# Altium project TC264.PrjPcb
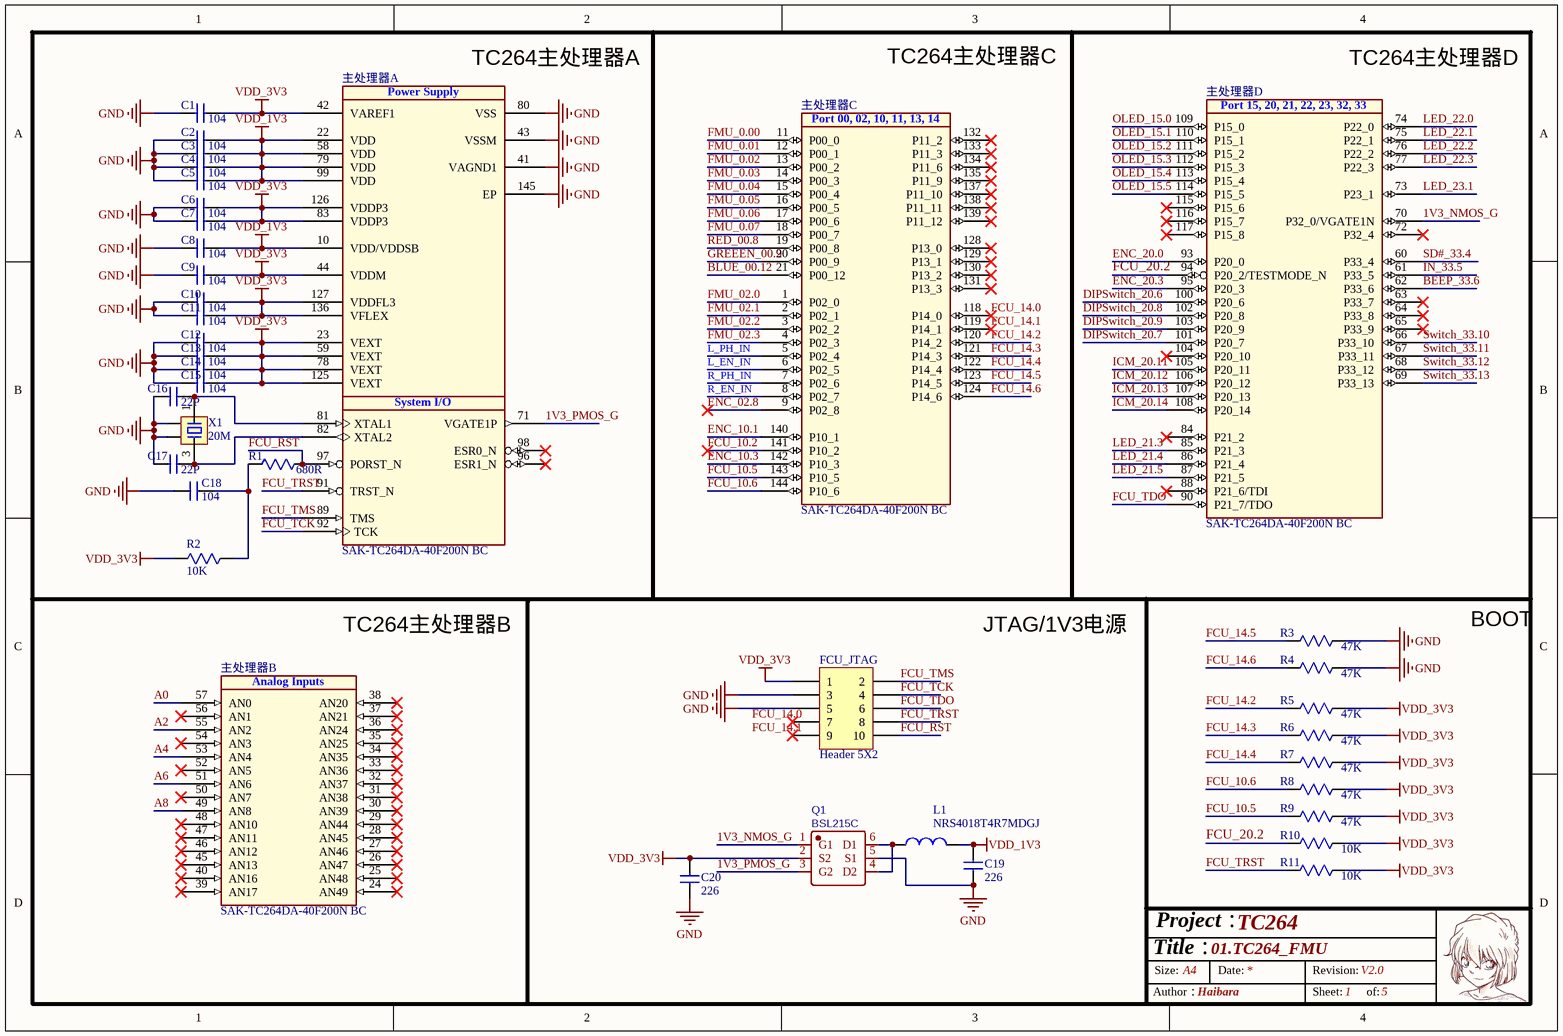
[diagram p0: 01.TC264_FMU.SchDoc]
4 sheets, 149 parts. Net scope: global (net labels, ports and power ports of the same name join across sheets).
Board file: TC264.PcbDoc
Sheets:
  01.TC264_FMU.SchDoc
  02.Power_Uint.SchDoc
  03.Communicate.SchDoc
  05.Motor_Drive.schdoc

## Sheet 01.TC264_FMU.SchDoc: 01.TC264_FMU
size A4; Revision: V2.0; SheetNumber: 1; SheetTotal: 5; Project: TC264

### Parts
C1  104  [C0402]
C2  104  [C0402]
C3  104  [C0402]
C4  104  [C0402]
C5  104  [C0402]
C6  104  [C0402]
C7  104  [C0402]
C8  104  [C0402]
C9  104  [C0402]
C10  104  [C0402]
C11  104  [C0402]
C12  104  [C0402]
C13  104  [C0402]
C14  104  [C0402]
C15  104  [C0402]
C16  22P  [C0603]
C17  22P  [C0603]
C18  104  [C0402]
C19  226  [C0805]
C20  226  [C0805]
FCU_JTAG  Header 5X2  [DC-2.54-L-Z-10P]
L1  NRS4018T4R7MDGJ  [SWPA4030S]
Q1  BSL215C  [SOT23-6]
R1  680R  [R0402]
R2  10K  [R0402]
R3  47K  [R0402]
R4  47K  [R0402]
R5  47K  [R0402]
R6  47K  [R0402]
R7  47K  [R0402]
R8  47K  [R0402]
R9  47K  [R0402]
R10  10K  [R0402]
R11  10K  [R0402]
X1  20M  [OSC 3225-4P]
主处理器  SAK-TC264DA-40F200N BC  [QFP144_EP]  (parts A,B,C,D of 4)

### Nets
GND: C1.1 C2.1 C3.1 C4.1 C5.1 C6.1 C7.1 C8.1 C9.1 C10.1 C11.1 C12.1 C13.1 C14.1 C15.1 C16.1 C17.1 C18.1 C19.1 C20.1 FCU_JTAG.3 FCU_JTAG.5 Q1.5(S1) R3.2 R4.2 X1.2 X1.4 主处理器.41(VAGND1) 主处理器.43(VSSM) 主处理器.80(VSS) 主处理器.145(EP)
VDD_1V3: C2.2 C3.2 C4.2 C5.2 C8.2 C19.2 L1.2 主处理器.10(VDD/VDDSB) 主处理器.22(VDD) 主处理器.58(VDD) 主处理器.79(VDD) 主处理器.99(VDD)
VDD_3V3: C1.2 C6.2 C7.2 C9.2 C10.2 C11.2 C12.2 C13.2 C14.2 C15.2 C20.2 FCU_JTAG.1 Q1.2(S2) R2.1 R5.2 R6.2 R7.2 R8.2 R9.2 R10.2 R11.2 主处理器.23(VEXT) 主处理器.42(VAREF1) 主处理器.44(VDDM) 主处理器.59(VEXT) 主处理器.78(VEXT) 主处理器.83(VDDP3) 主处理器.125(VEXT) 主处理器.126(VDDP3) 主处理器.127(VDDFL3) 主处理器.136(VFLEX)
1V3_NMOS_G: Q1.1(G1) 主处理器.70(P32_0/VGATE1N)
1V3_PMOS_G: Q1.3(G2) 主处理器.71(VGATE1P)
A0: 主处理器.57(AN0)
A2: 主处理器.55(AN2)
A4: 主处理器.53(AN4)
A6: 主处理器.51(AN6)
A8: 主处理器.49(AN8)
BEEP_33.6: 主处理器.62(P33_6)
BLUE_00.12: 主处理器.21(P00_12)
DIPSwitch_20.6: 主处理器.100(P20_6)
DIPSwitch_20.7: 主处理器.101(P20_7)
DIPSwitch_20.8: 主处理器.102(P20_8)
DIPSwitch_20.9: 主处理器.103(P20_9)
ENC_02.8: 主处理器.9(P02_8)
ENC_10.1: 主处理器.140(P10_1)
ENC_10.3: 主处理器.142(P10_3)
ENC_20.0: 主处理器.93(P20_0)
ENC_20.3: 主处理器.95(P20_3)
FCU_10.2: 主处理器.141(P10_2)
FCU_10.5: R9.1 主处理器.143(P10_5)
FCU_10.6: R8.1 主处理器.144(P10_6)
FCU_14.0: 主处理器.118(P14_0)
FCU_14.1: 主处理器.119(P14_1)
FCU_14.2: R5.1 主处理器.120(P14_2)
FCU_14.3: R6.1 主处理器.121(P14_3)
FCU_14.4: R7.1 主处理器.122(P14_4)
FCU_14.5: R3.1 主处理器.123(P14_5)
FCU_14.6: R4.1 主处理器.124(P14_6)
FCU_20.2: R10.1 主处理器.94(P20_2/TESTMODE_N)
FCU_RST: FCU_JTAG.10 R1.2 主处理器.97(PORST_N)
FCU_TCK: FCU_JTAG.4 主处理器.92(TCK)
FCU_TDO: FCU_JTAG.6 主处理器.90(P21_7/TDO)
FCU_TMS: FCU_JTAG.2 主处理器.89(TMS)
FCU_TRST: FCU_JTAG.8 R11.1 主处理器.91(TRST_N)
FMU_0.00: 主处理器.11(P00_0)
FMU_0.01: 主处理器.12(P00_1)
FMU_0.02: 主处理器.13(P00_2)
FMU_0.03: 主处理器.14(P00_3)
FMU_0.04: 主处理器.15(P00_4)
FMU_0.05: 主处理器.16(P00_5)
FMU_0.06: 主处理器.17(P00_6)
FMU_0.07: 主处理器.18(P00_7)
FMU_02.0: 主处理器.1(P02_0)
FMU_02.1: 主处理器.2(P02_1)
FMU_02.2: 主处理器.3(P02_2)
FMU_02.3: 主处理器.4(P02_3)
GREEEN_00.9: 主处理器.20(P00_9)
ICM_20.11: 主处理器.105(P20_11)
ICM_20.12: 主处理器.106(P20_12)
ICM_20.13: 主处理器.107(P20_13)
ICM_20.14: 主处理器.108(P20_14)
IN_33.5: 主处理器.61(P33_5)
L_EN_IN: 主处理器.6(P02_5)
L_PH_IN: 主处理器.5(P02_4)
LED_21.3: 主处理器.85(P21_3)
LED_21.4: 主处理器.86(P21_4)
LED_21.5: 主处理器.87(P21_5)
LED_22.0: 主处理器.74(P22_0)
LED_22.1: 主处理器.75(P22_1)
LED_22.2: 主处理器.76(P22_2)
LED_22.3: 主处理器.77(P22_3)
LED_23.1: 主处理器.73(P23_1)
OLED_15.0: 主处理器.109(P15_0)
OLED_15.1: 主处理器.110(P15_1)
OLED_15.2: 主处理器.111(P15_2)
OLED_15.3: 主处理器.112(P15_3)
OLED_15.4: 主处理器.113(P15_4)
OLED_15.5: 主处理器.114(P15_5)
R_EN_IN: 主处理器.8(P02_7)
R_PH_IN: 主处理器.7(P02_6)
RED_00.8: 主处理器.19(P00_8)
SD#_33.4: 主处理器.60(P33_4)
Switch_33.10: 主处理器.66(P33_10)
Switch_33.11: 主处理器.67(P33_11)
Switch_33.12: 主处理器.68(P33_12)
Switch_33.13: 主处理器.69(P33_13)
NetC16_2: C16.2 X1.1 主处理器.81(XTAL1)
NetC17_2: C17.2 X1.3 主处理器.82(XTAL2)
NetC18_2: C18.2 R1.1 R2.2
NetL1_1: L1.1 Q1.4(D2) Q1.6(D1)

Not connected (* = marked no-connect by the designer): FCU_JTAG 7* 9*; 主处理器 24(AN49)* 25(AN48)* 26(AN47)* 27(AN46)* 28(AN45)* 29(AN44)* 30(AN39)* 31(AN38)* 32(AN37)* 33(AN36)* 34(AN35)* 35(AN25)* 36(AN24)* 37(AN21)* 38(AN20)* 39(AN17)* 40(AN16)* 45(AN13)* 46(AN12)* 47(AN11)* 48(AN10)* 50(AN7)* 52(AN5)* 54(AN3)* 56(AN1)* 63(P33_7)* 64(P33_8)* 65(P33_9)* 72(P32_4)* 84(P21_2)* 88(P21_6/TDI)* 96(ESR1_N)* 98(ESR0_N)* 104(P20_10)* 115(P15_6)* 116(P15_7)* 117(P15_8)* 128(P13_0)* 129(P13_1)* 130(P13_2)* 131(P13_3)* 132(P11_2)* 133(P11_3)* 134(P11_6)* 135(P11_9)* 137(P11_10)* 138(P11_11)* 139(P11_12)*

### Notes on the sheet
- (near 主处理器) TC264主处理器A
- TC264主处理器C
- TC264主处理器D
- TC264主处理器B
- JTAG/1V3电源
- BOOT
- Labels drawn without touching a wire or pin: FCU_14.0, FCU_14.1
- Title：
- Size:
- Project：
- A4
- Date:
- Revision:
- Author：
- Haibara
- Sheet:
- of:
- (in symbol SAK-TC264DA-40F200N BC, part A) Power Supply; System I/O
- (in symbol SAK-TC264DA-40F200N BC, part B) Analog Inputs
- (in symbol SAK-TC264DA-40F200N BC, part C) Port 00, 02, 10, 11, 13, 14
- (in symbol SAK-TC264DA-40F200N BC, part D) Port 15, 20, 21, 22, 23, 32, 33

### Library data of the parts
C1-C20 = 电容
FCU_JTAG = Header 5X2: Header, 5-Pin, Dual row; LatestRevisionDate: 17-Jul-2002; LatestRevisionNote: Re-released for DXP Platform.; Publisher: Altium Limited
L1 = 电感
Q1 = BSL215CH6327XTSA1: BOM_Manufacturer: Infineon; Contributor: LCSC; BOM_Supplier: LCSC; BOM_Manufacturer Part: BSL215CH6327XTSA1; BOM_Supplier Part: C150914; BOM_JLCPCB Part Class: Extended Part; spicePre: Q; spiceSymbolName: BSL215CH6327XTSA1
R1-R11 = 电阻
X1 = XTAL-4P: 4脚无源晶振; 版权归属: 源创客; BOM名称: 4脚无源晶振; 学习资源: www.ooocke.com
主处理器 = SAK-TC264DA-40F200N BC: 32-Bit Single-Chip Microcontroller BC-Step; Manufacturer: Infineon Technologies; PackageReference: PG-LQFP-144-22; ManufacturerPartNumber: SAK-TC264DA-40F200N BC

## Sheet 02.Power_Uint.SchDoc: 02.Power_Uint
size A4; Organization: Altium Limited; Address1: L3, 12a Rodborough Rd; Address2: Frenchs Forest; Address3: NSW; Address4: Australia 2086; Revision: V2.0; SheetNumber: 2; SheetTotal: 5; Project: TC264
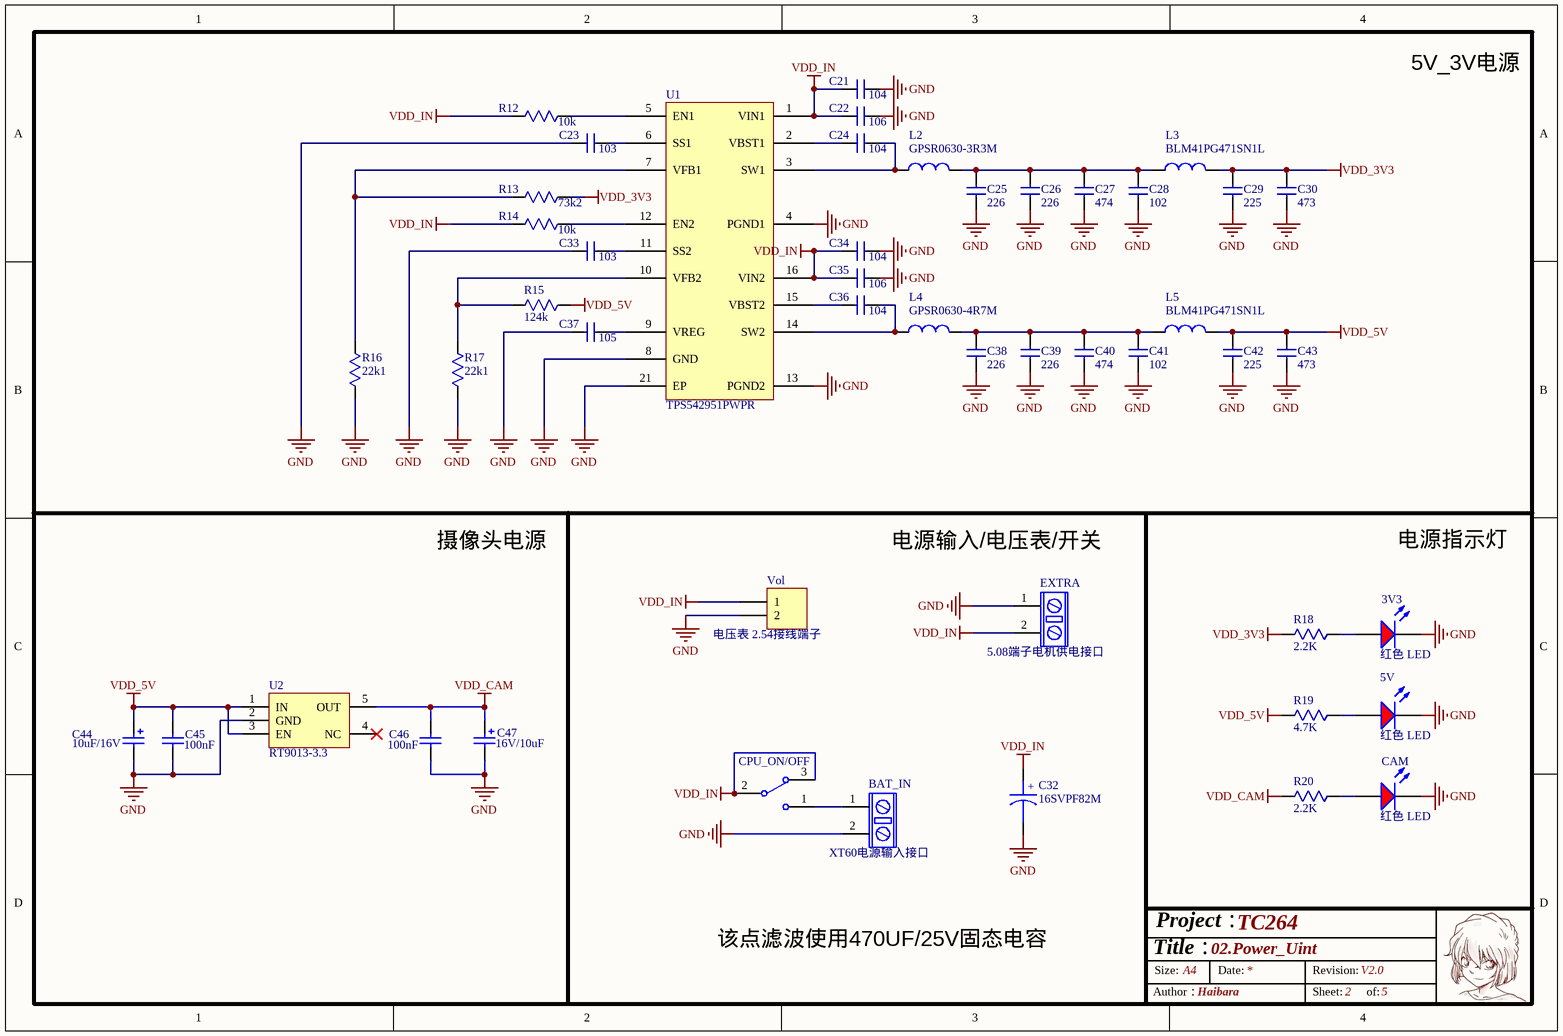
[diagram p1: 02.Power_Uint.SchDoc]

### Parts
3V3  红色 LED  [0603 LED R]
5V  红色 LED  [0603 LED R]
BAT_IN  XT60电源输入接口  [TX60PW-M20]
C21  104  [C0603]
C22  106  [C0805]
C23  103  [C0603]
C24  104  [C0805]
C25  226  [C0805]
C26  226  [C0805]
C27  474  [C0603]
C28  102  [C0603]
C29  225  [C0603]
C30  473  [C0603]
C32  16SVPF82M  [CAP 2.5*6.3*11.2]
C33  103  [C0603]
C34  104  [C0603]
C35  106  [C0805]
C36  104  [C0805]
C37  105  [C0603]
C38  226  [C0805]
C39  226  [C0805]
C40  474  [C0603]
C41  102  [C0603]
C42  225  [C0603]
C43  473  [C0603]
C44  10UF  [C0805]  (value not drawn)
C45  100nF  [0603 电容 C3]
C46  100nF  [0603 电容 C3]
C47  value 16V/10uF  [C0805]  (hidden comment: 10UF)
CAM  红色 LED  [0603 LED R]
CPU_ON/OFF  SW-SPDT  [MTS-102S 两档纽子开关]  (value not drawn)
EXTRA  5.08端子电机供电接口  [5.08 2P 螺钉端子]
L2  GPSR0630-3R3M  [L 0630]
L3  BLM41PG471SN1L  [R1206]
L4  GPSR0630-4R7M  [L 0630]
L5  BLM41PG471SN1L  [R1206]
R12  10k  [R0603]
R13  73k2  [R0603]
R14  10k  [R0603]
R15  124k  [R0603]
R16  22k1  [R0603]
R17  22k1  [R0603]
R18  2.2K  [R0603]
R19  4.7K  [R0603]
R20  2.2K  [R0603]
U1  TPS542951PWPR  [SSOP16_EP]
U2  RT9013-3.3  [SOT23-5N]
Vol  电压表 2.54接线端子  [XH2.54-LI-2P]

### Nets
GND: 3V3.2 5V.2 BAT_IN.2 C21.2 C22.2 C23.1 C25.1 C26.1 C27.1 C28.1 C29.1 C30.1 C32.2 C33.1 C34.2 C35.2 C37.1 C38.1 C39.1 C40.1 C41.1 C42.1 C43.1 C44.2 C45.1 C46.1 C47.2 CAM.2 EXTRA.1 R16.1 R17.1 U1.4(PGND1) U1.8(GND) U1.13(PGND2) U1.21(EP) U2.2(GND) Vol.2
VDD_3V3: C29.2 C30.2 L3.2 R13.1 R18.1
VDD_5V: C42.2 C43.2 C44.1 C45.2 L5.2 R15.1 R19.1 U2.1(IN) U2.3(EN)
VDD_CAM: C46.2 C47.1 R20.1 U2.5(OUT)
VDD_IN: C21.1 C22.1 C32.1 C34.1 C35.1 CPU_ON/OFF.2 CPU_ON/OFF.3 EXTRA.2 R12.2 R14.2 U1.1(VIN1) U1.16(VIN2) Vol.1
Net3V3_1: 3V3.1 R18.2
Net5V_1: 5V.1 R19.2
NetBAT_IN_1: BAT_IN.1 CPU_ON/OFF.1
NetC23_2: C23.2 U1.6(SS1)
NetC24_1: C24.1 U1.2(VBST1)
NetC24_2: C24.2 L2.1 U1.3(SW1)
NetC25_2: C25.2 C26.2 C27.2 C28.2 L2.2 L3.1
NetC33_2: C33.2 U1.11(SS2)
NetC36_1: C36.1 U1.15(VBST2)
NetC36_2: C36.2 L4.1 U1.14(SW2)
NetC37_2: C37.2 U1.9(VREG)
NetC38_2: C38.2 C39.2 C40.2 C41.2 L4.2 L5.1
NetCAM_1: CAM.1 R20.2
NetR12_1: R12.1 U1.5(EN1)
NetR13_2: R13.2 R16.2 U1.7(VFB1)
NetR14_1: R14.1 U1.12(EN2)
NetR15_2: R15.2 R17.2 U1.10(VFB2)

Not connected (* = marked no-connect by the designer): U2 4(NC)*

### Notes on the sheet
- 该点滤波使用470UF/25V固态电容
- Labels drawn without touching a wire or pin: 5V_3V电源, 摄像头电源, 电源指示灯, 电源输入/电压表/开关
- Title：
- Size:
- Project：
- A4
- Date:
- Revision:
- Author：
- Haibara
- Sheet:
- of:
- (in symbol CAP POL) +
- (in symbol Cap Pol2) 16V

### Library data of the parts
3V3 5V CAM = 红灯: 发光二极管; ComponentLink1Description: 供应商链接; ComponentLink1URL: http://www.szlcsc.com/product/details_2668.html; Package: 0805; Supplier: LC; SuppliersPartNumber: C2295
BAT_IN EXTRA = 电机供电接口
C21-C30 C33-C43 = 电容
C32 = CAP POL: Capacitor
C44 C47 = Cap Pol2: Polarized Capacitor (Axial); Published: 8-Jun-2000; LatestRevisionDate: 17-Jul-2002; LatestRevisionNote: Re-released for DXP Platform.; PackageReference: POLAR0.8; Publisher: Altium Limited; PackageDescription: Polarized Capacitor; 2 Leads
C45 C46 = Cap: Capacitor; Published: 8-Jun-2000; LatestRevisionDate: 17-Jul-2002; LatestRevisionNote: Re-released for DXP Platform.; PackageReference: RAD-0.3; Publisher: Altium Limited; PackageDescription: Radial Cap, Thru-Hole; 2 Leads; 0.3 in Pin Spacing
CPU_ON/OFF = SW-SPDT: SPDT Subminiature Toggle Switch, Right Angle Mounting, Vertical Actuation; Published: 24-Mar-1999; LatestRevisionDate: 17-Dec-2003; LatestRevisionNote: Schematic revised, PCB Footprint replaced.; DatasheetVersion: 05-Dec-2000; PackageReference: TL36WW15050; Publisher: Altium Limited; PackageDescription: Switch; 4 Leads; ComponentLink1Description: Manufacturer Link; ComponentLink1URL: http://www.apem.com
L2 L4 = 电感
L3 L5 = 磁珠: BLM18PG471SN1D
R12-R20 = 电阻
U2 = RT9013-3.3: 3.3V电源芯片
Vol = Header 2: Header, 2-Pin; LatestRevisionDate: 17-Jul-2002; LatestRevisionNote: Re-released for DXP Platform.; Publisher: Altium Limited

## Sheet 03.Communicate.SchDoc: 03.Communicate
size A4; Revision: V2.0; SheetNumber: 3; SheetTotal: 5; Project: TC264
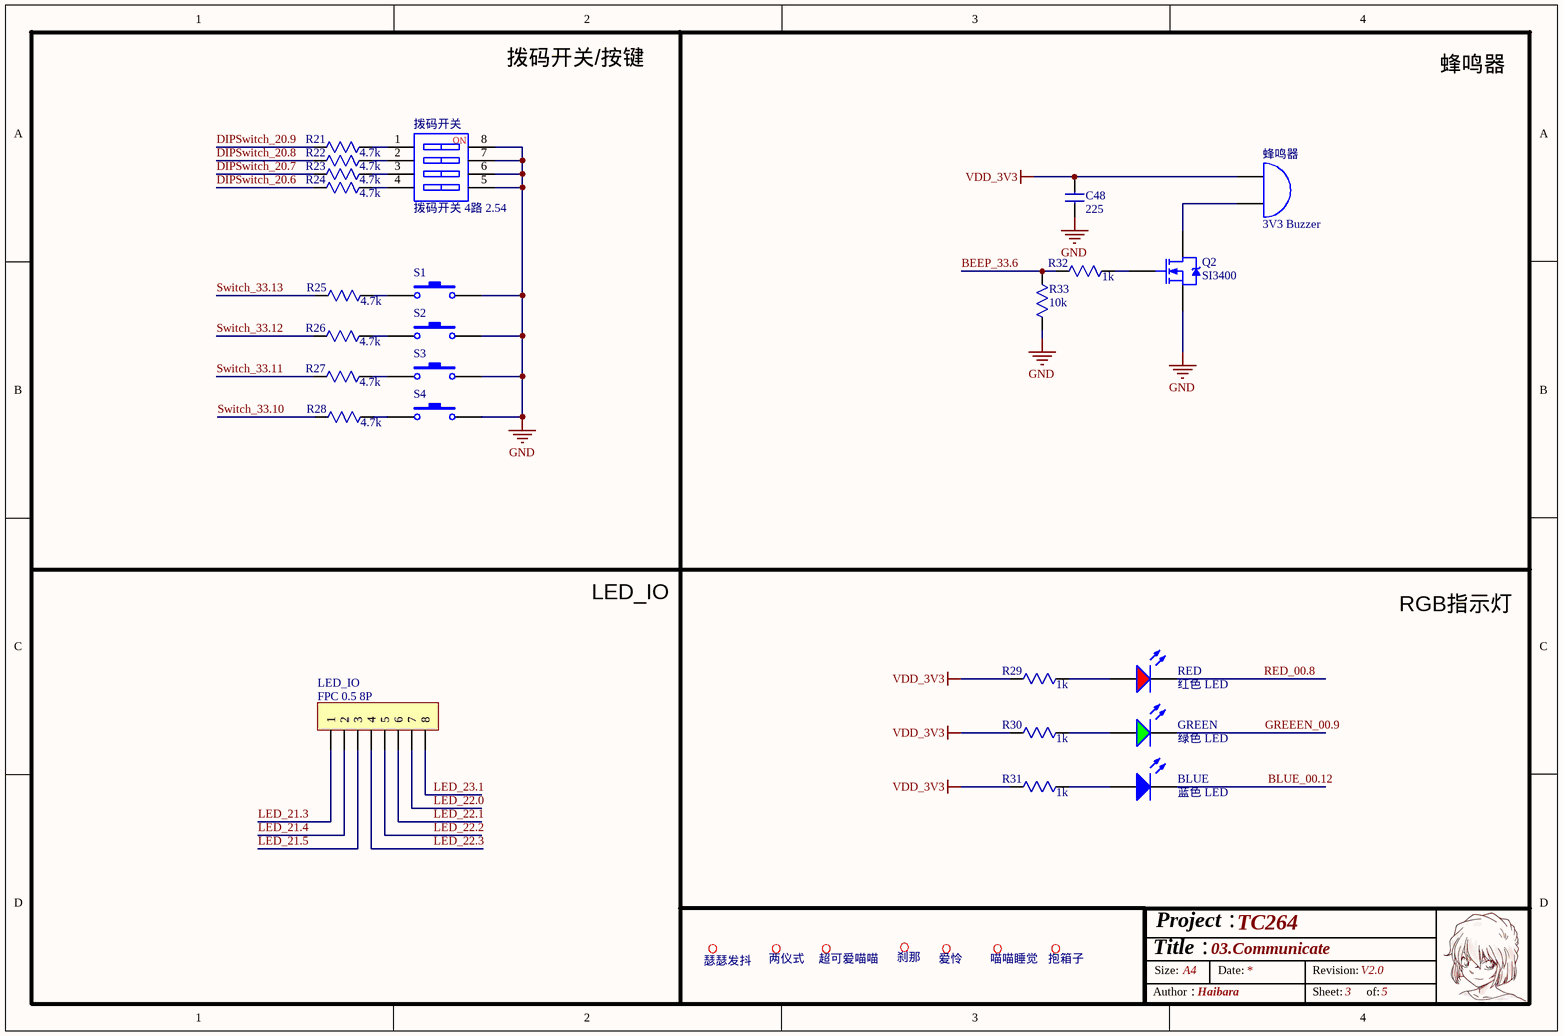
[diagram p2: 03.Communicate.SchDoc]

### Parts
(Parts that share a designator on the sheet are numbered #1, #2 ... from top to bottom, then left to right.)
?#1  瑟瑟发抖  [IMPORTED_IMAGE - duplicate6]
?#2  两仪式  [两仪式]
?#3  超可爱喵喵  [喵喵]
?#4  刹那  [刹那]
?#5  爱怜  [爱怜]
?#6  喵喵睡觉  [喵喵睡觉]
?#7  抱箱子  [抱箱子_大]
BLUE  蓝色 LED  [0603 LED B]
C48  225  [C0603]
GREEN  绿色 LED  [0603 LED G]
LED_IO  FPC 0.5 8P  [FPC0.5 2H-WS-8P]
Q2  SI3400  [SOT-23]
R21  4.7k  [R0603]
R22  4.7k  [R0603]
R23  4.7k  [R0603]
R24  4.7k  [R0603]
R25  4.7k  [R0603]
R26  4.7k  [R0603]
R27  4.7k  [R0603]
R28  4.7k  [R0603]
R29  1k  [R0603]
R30  1k  [R0603]
R31  1k  [R0603]
R32  1k  [R0603]
R33  10k  [R0603]
RED  红色 LED  [0603 LED R]
S1  SW-PB  [TSW SMD-3*6*2.5]  (value not drawn)
S2  SW-PB  [TSW SMD-3*6*2.5]  (value not drawn)
S3  SW-PB  [TSW SMD-3*6*2.5]  (value not drawn)
S4  SW-PB  [TSW SMD-3*6*2.5]  (value not drawn)
拨码开关  拨码开关 4路 2.54  [CSW DIP-2P_G]
蜂鸣器  3V3 Buzzer  [贴片有源蜂鸣器 9.6x9.6x5]

### Nets
GND: C48.2 Q2.2(S) R33.1 S1.2 S2.2 S3.2 S4.2 拨码开关.5 拨码开关.6 拨码开关.7 拨码开关.8
VDD_3V3: C48.1 R29.1 R30.1 R31.1 蜂鸣器.1(A)
BEEP_33.6: R32.1 R33.2
BLUE_00.12: BLUE.2
DIPSwitch_20.6: R24.1
DIPSwitch_20.7: R23.1
DIPSwitch_20.8: R22.1
DIPSwitch_20.9: R21.1
GREEEN_00.9: GREEN.2
LED_21.3: LED_IO.1
LED_21.4: LED_IO.2
LED_21.5: LED_IO.3
LED_22.0: LED_IO.7
LED_22.1: LED_IO.6
LED_22.2: LED_IO.5
LED_22.3: LED_IO.4
LED_23.1: LED_IO.8
RED_00.8: RED.2
Switch_33.10: R28.1
Switch_33.11: R27.1
Switch_33.12: R26.1
Switch_33.13: R25.1
NetBLUE_1: BLUE.1 R31.2
NetGREEN_1: GREEN.1 R30.2
NetQ2_1: Q2.1(G) R32.2
NetQ2_3: Q2.3(D) 蜂鸣器.2(B)
NetR21_2: R21.2 拨码开关.1
NetR22_2: R22.2 拨码开关.2
NetR23_2: R23.2 拨码开关.3
NetR24_2: R24.2 拨码开关.4
NetR25_2: R25.2 S1.1
NetR26_2: R26.2 S2.1
NetR27_2: R27.2 S3.1
NetR28_2: R28.2 S4.1
NetR29_2: R29.2 RED.1

### Notes on the sheet
- 拨码开关/按键
- 蜂鸣器
- LED_IO
- RGB指示灯
- Title：
- Size:
- Project：
- A4
- Date:
- Revision:
- Author：
- Haibara
- Sheet:
- of:
- (in symbol CSW-4P) NO

### Library data of the parts
BLUE = 蓝灯: 发光二极管; ComponentLink1Description: 供应商链接; ComponentLink1URL: http://www.szlcsc.com/product/details_2666.html; Package: 0805; Supplier: LC; SuppliersPartNumber: C2293
C48 = 电容
GREEN = 绿灯: 发光二极管; ComponentLink1Description: 供应商链接; ComponentLink1URL: http://www.szlcsc.com/product/details_2670.html; Package: 0805; Supplier: LC; SuppliersPartNumber: C2297
LED_IO = Header 8: 8P接插件; 版权归属: 封装库来自淘宝 ID：黄晶宝石; BOM名称: 8P接插件; 学习资源: https://shop463601444.taobao.com
Q2 = NMOS: N-Channel Power MOSFET 40V 100A 1.8mΩ; Note: Pin 2 is electrically connected to pin 4.; Published: 8-Jun-2000; LatestRevisionDate: 17-Jul-2002; LatestRevisionNote: Re-released for DXP Platform.; DatasheetVersion: PD-9.814; PackageVersion: Feb-1997; PackageReference: TO-220AB; Publisher: Altium Limited; PackageDescription: TO, Thru-Hole, Vertical, Heatsink Mounted; 3 In-Line Leads; Pitch 2.54 mm; ComponentLink1Description: Manufacturer Link; ComponentLink1URL: http://www.irf.com/
R21-R33 = 电阻
RED = 红灯: 发光二极管; ComponentLink1Description: 供应商链接; ComponentLink1URL: http://www.szlcsc.com/product/details_2668.html; Package: 0805; Supplier: LC; SuppliersPartNumber: C2295
S1-S4 = SW-PB: Switch; Published: 24-Mar-1999; LatestRevisionDate: 17-Jul-2002; LatestRevisionNote: Re-released for DXP Platform.; PackageReference: SPST-2; Publisher: Altium Limited; PackageDescription: Switch; 2 Leads
拨码开关 = CSW-4P: 4路编码开关; 版权归属: 源创客; BOM名称: 4路编码开关; 学习资源: www.ooocke.com
蜂鸣器 = Bell: Electrical Bell; Published: 24-Mar-1999; LatestRevisionDate: 17-Jul-2002; LatestRevisionNote: Re-released for DXP Platform.; PackageReference: PIN2; Publisher: Altium Limited

## Sheet 05.Motor_Drive.schdoc: 05.Motor_Drive
size A4; Revision: V2.0; SheetNumber: 5; SheetTotal: 5; Project: TC264
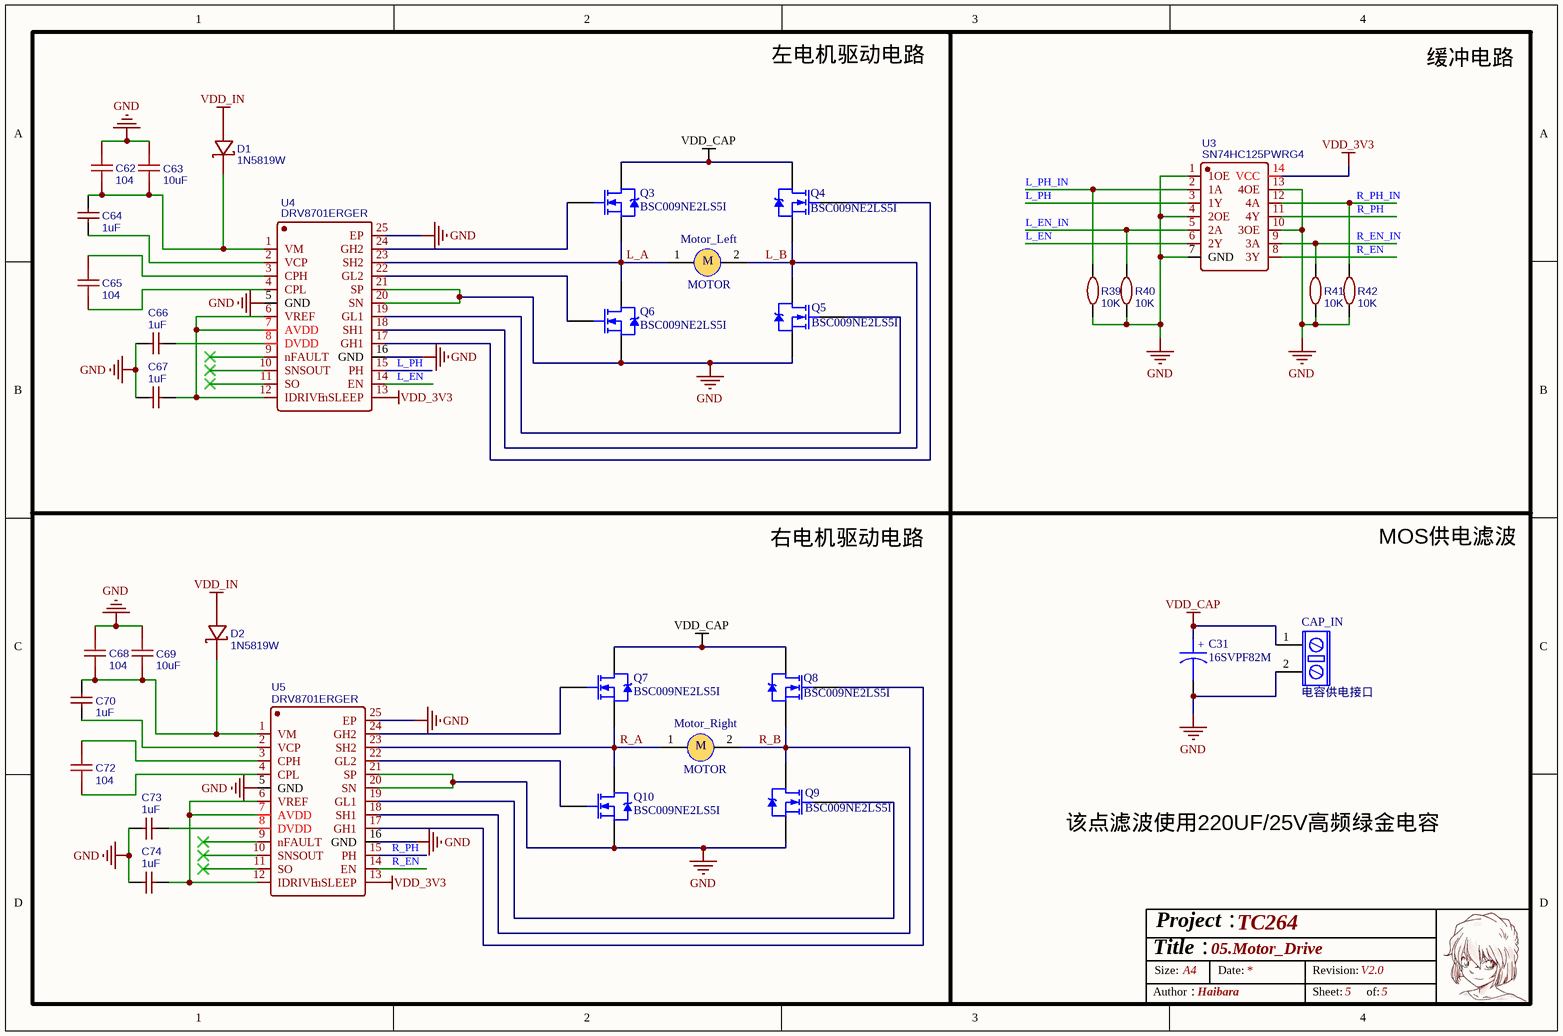
[diagram p3: 05.Motor_Drive.schdoc]

### Parts
C31  16SVPF82M  [CAP 2.5*6.3*11.2]
C62  104  [C0603]
C63  10uF  [C0805]
C64  1uF  [C0603]
C65  104  [C0603]
C66  1uF  [C0603]
C67  1uF  [C0603]
C68  104  [C0603]
C69  10uF  [C0805]
C70  1uF  [C0603]
C72  104  [C0603]
C73  1uF  [C0603]
C74  1uF  [C0603]
CAP_IN  电容供电接口  [5.08 2P 螺钉端子]
D1  1N5819W  [SOD-123F_L2.8-W1.8-LS3.7-RD]
D2  1N5819W  [SOD-123F_L2.8-W1.8-LS3.7-RD]
Motor_Left  MOTOR  [XT30 母头 电源插头]
Motor_Right  MOTOR  [XT30 母头 电源插头]
Q3  BSC009NE2LS5I  [PSON-8 MOS]
Q4  BSC009NE2LS5I  [PSON-8 MOS]
Q5  BSC009NE2LS5I  [PSON-8 MOS]
Q6  BSC009NE2LS5I  [PSON-8 MOS]
Q7  BSC009NE2LS5I  [PSON-8 MOS]
Q8  BSC009NE2LS5I  [PSON-8 MOS]
Q9  BSC009NE2LS5I  [PSON-8 MOS]
Q10  BSC009NE2LS5I  [PSON-8 MOS]
R39  10K  [R0603]
R40  10K  [R0603]
R41  10K  [R0603]
R42  10K  [R0603]
U3  SN74HC125PWRG4  [TSSOP-14_L5.0-W4.4-P0.65-LS6.4-TL]
U4  DRV8701ERGER  [VQFN-24_L4.0-W4.0-P0.50-BL-EP2.8]
U5  DRV8701ERGER  [VQFN-24_L4.0-W4.0-P0.50-BL-EP2.8]

### Nets
GND: C31.2 C62.2 C63.1 C66.2 C67.2 C68.2 C69.1 C73.2 C74.2 CAP_IN.2 Q5.1(S) Q6.1(S) Q9.1(S) Q10.1(S) R39.1 R40.1 R41.1 R42.1 U3.1(1OE) U3.4(2OE) U3.7(GND) U3.10(3OE) U3.13(4OE) U4.5(GND) U4.16(GND) U4.20(SN) U4.21(SP) U4.25(EP) U5.5(GND) U5.16(GND) U5.20(SN) U5.21(SP) U5.25(EP)
VDD_3V3: U3.14(VCC) U4.13(nSLEEP) U5.13(nSLEEP)
VDD_CAP: C31.1 CAP_IN.1 Q3.3(D) Q4.3(D) Q7.3(D) Q8.3(D)
VDD_IN: D1.2 D2.2
L_A: Motor_Left.1 Q3.1(S) Q6.3(D) U4.23(SH2)
L_B: Motor_Left.2 Q4.1(S) Q5.3(D) U4.18(SH1)
L_EN: U3.6(2Y) U4.14(EN)
L_EN_IN: R40.2 U3.5(2A)
L_PH: U3.3(1Y) U4.15(PH)
L_PH_IN: R39.2 U3.2(1A)
R_A: Motor_Right.1 Q7.1(S) Q10.3(D) U5.23(SH2)
R_B: Motor_Right.2 Q8.1(S) Q9.3(D) U5.18(SH1)
R_EN: U3.8(3Y) U5.14(EN)
R_EN_IN: R41.2 U3.9(3A)
R_PH: U3.11(4Y) U5.15(PH)
R_PH_IN: R42.2 U3.12(4A)
NetC62_1: C62.1 C63.2 C64.2 D1.1 U4.1(VM)
NetC64_1: C64.1 U4.2(VCP)
NetC65_1: C65.1 U4.4(CPL)
NetC65_2: C65.2 U4.3(CPH)
NetC66_1: C66.1 U4.8(DVDD)
NetC67_1: C67.1 U4.6(VREF) U4.7(AVDD) U4.12(IDRIVE)
NetC68_1: C68.1 C69.2 C70.2 D2.1 U5.1(VM)
NetC70_1: C70.1 U5.2(VCP)
NetC72_1: C72.1 U5.4(CPL)
NetC72_2: C72.2 U5.3(CPH)
NetC73_1: C73.1 U5.8(DVDD)
NetC74_1: C74.1 U5.6(VREF) U5.7(AVDD) U5.12(IDRIVE)
NetQ3_2: Q3.2(G) U4.24(GH2)
NetQ4_2: Q4.2(G) U4.17(GH1)
NetQ5_2: Q5.2(G) U4.19(GL1)
NetQ6_2: Q6.2(G) U4.22(GL2)
NetQ7_2: Q7.2(G) U5.24(GH2)
NetQ8_2: Q8.2(G) U5.17(GH1)
NetQ9_2: Q9.2(G) U5.19(GL1)
NetQ10_2: Q10.2(G) U5.22(GL2)

Not connected (* = marked no-connect by the designer): U4 9(nFAULT)* 10(SNSOUT)* 11(SO)*; U5 9(nFAULT)* 10(SNSOUT)* 11(SO)*

### Notes on the sheet
- 左电机驱动电路
- 缓冲电路
- 右电机驱动电路
- MOS供电滤波
- 该点滤波使用220UF/25V高频绿金电容
- Title：
- Size:
- Project：
- A4
- Date:
- Revision:
- Author：
- Haibara
- Sheet:
- of:
- (in symbol CAP POL) +
- (in symbol CSD87350Q5D) D; G; S
- (in symbol MOTOR1) M

### Library data of the parts
C31 = CAP POL: Capacitor
C62 C65 C68 C72 = 0.1u: nameAlias: Value(F); Contributor: LCEDA_Lib; spicePre: C; spiceSymbolName: C_0603_US
C63 C69 = 10uF: BOM_Manufacturer: Huaxin S&T; BOM_Manufacturer Part: 0805F106Z160CT; nameAlias: Capacitance; Contributor: LCSC; BOM_Supplier: LCSC; BOM_Supplier Part: C303921; BOM_JLCPCB Part Class: Extended Part; spicePre: C; spiceSymbolName: 0805F106Z160CT
C64 C66 C67 C70 C73 C74 = 1uF: BOM_Manufacturer Part: CL10B105KO8NNNC; BOM_Manufacturer: SAMSUNG; nameAlias: Capacitance; BOM_Supplier: LCSC; BOM_Supplier Part: C59782; BOM_JLCPCB Part Class: Extended Part; spicePre: C; spiceSymbolName: CL10B105KO8NNNC
CAP_IN = 电机供电接口
D1 D2 = 1N5819W: BOM_Manufacturer: Shandong Jingdao Microelectronics; Contributor: LCSC; BOM_Supplier: LCSC; BOM_Supplier Part: C169540; BOM_Manufacturer Part: 1N5819W; BOM_JLCPCB Part Class: Extended Part; spicePre: D; spiceSymbolName: 1N5819W
Motor_Left Motor_Right = MOTOR1
Q3-Q10 = NMOS: as Q2 on sheet 03.Communicate; Published: 8-Jun-2000; LatestRevisionDate: 17-Jul-2002; LatestRevisionNote: Re-released for DXP Platform.; DatasheetVersion: PD-9.814; PackageVersion: Feb-1997; PackageReference: TO-220AB; Publisher: Altium Limited; PackageDescription: TO, Thru-Hole, Vertical, Heatsink Mounted; 3 In-Line Leads; Pitch 2.54 mm; ComponentLink1Description: Manufacturer Link; ComponentLink1URL: http://www.irf.com/
R39-R42 = 10K: BOM_Manufacturer: YAGEO; BOM_Manufacturer Part: RT0603BRD0710KL; nameAlias: Resistance (Ohms); Resistance: 10kΩ; BOM_Supplier: LCSC; BOM_Supplier Part: C95204; BOM_JLCPCB Part Class: Extended Part; spicePre: R; spiceSymbolName: RT0603BRD0710KL
U3 = SN74HC125PWRG4: BOM_Manufacturer: TI(德州仪器); Contributor: LCSC; BOM_Supplier: LCSC; BOM_Supplier Part: C2676184; BOM_Manufacturer Part: SN74HC125PWRG4; BOM_JLCPCB Part Class: Extended Part; spicePre: U; spiceSymbolName: SN74HC125PWRG4
U4 U5 = DRV8701ERGER: BOM_Manufacturer: Texas Instruments; Contributor: LCSC; BOM_Supplier: LCSC; BOM_Supplier Part: C90964; BOM_Manufacturer Part: DRV8701ERGER; BOM_JLCPCB Part Class: Extended Part; spicePre: U; spiceSymbolName: DRV8701ERGER

## Nets that join several sheets
GND: 01.TC264_FMU (31 pins), 02.Power_Uint (37 pins), 03.Communicate (11 pins), 05.Motor_Drive (33 pins)
VDD_3V3: 01.TC264_FMU (31 pins), 02.Power_Uint (5 pins), 03.Communicate (5 pins), 05.Motor_Drive (U3.14 U4.13 U5.13)
VDD_IN: 02.Power_Uint (13 pins), 05.Motor_Drive (D1.2 D2.2)
BEEP_33.6: 01.TC264_FMU (主处理器.62), 03.Communicate (R32.1 R33.2)
BLUE_00.12: 01.TC264_FMU (主处理器.21), 03.Communicate (BLUE.2)
DIPSwitch_20.6: 01.TC264_FMU (主处理器.100), 03.Communicate (R24.1)
DIPSwitch_20.7: 01.TC264_FMU (主处理器.101), 03.Communicate (R23.1)
DIPSwitch_20.8: 01.TC264_FMU (主处理器.102), 03.Communicate (R22.1)
DIPSwitch_20.9: 01.TC264_FMU (主处理器.103), 03.Communicate (R21.1)
GREEEN_00.9: 01.TC264_FMU (主处理器.20), 03.Communicate (GREEN.2)
L_EN_IN: 01.TC264_FMU (主处理器.6), 05.Motor_Drive (R40.2 U3.5)
L_PH_IN: 01.TC264_FMU (主处理器.5), 05.Motor_Drive (R39.2 U3.2)
LED_21.3: 01.TC264_FMU (主处理器.85), 03.Communicate (LED_IO.1)
LED_21.4: 01.TC264_FMU (主处理器.86), 03.Communicate (LED_IO.2)
LED_21.5: 01.TC264_FMU (主处理器.87), 03.Communicate (LED_IO.3)
LED_22.0: 01.TC264_FMU (主处理器.74), 03.Communicate (LED_IO.7)
LED_22.1: 01.TC264_FMU (主处理器.75), 03.Communicate (LED_IO.6)
LED_22.2: 01.TC264_FMU (主处理器.76), 03.Communicate (LED_IO.5)
LED_22.3: 01.TC264_FMU (主处理器.77), 03.Communicate (LED_IO.4)
LED_23.1: 01.TC264_FMU (主处理器.73), 03.Communicate (LED_IO.8)
R_EN_IN: 01.TC264_FMU (主处理器.8), 05.Motor_Drive (R41.2 U3.9)
R_PH_IN: 01.TC264_FMU (主处理器.7), 05.Motor_Drive (R42.2 U3.12)
RED_00.8: 01.TC264_FMU (主处理器.19), 03.Communicate (RED.2)
Switch_33.10: 01.TC264_FMU (主处理器.66), 03.Communicate (R28.1)
Switch_33.11: 01.TC264_FMU (主处理器.67), 03.Communicate (R27.1)
Switch_33.12: 01.TC264_FMU (主处理器.68), 03.Communicate (R26.1)
Switch_33.13: 01.TC264_FMU (主处理器.69), 03.Communicate (R25.1)